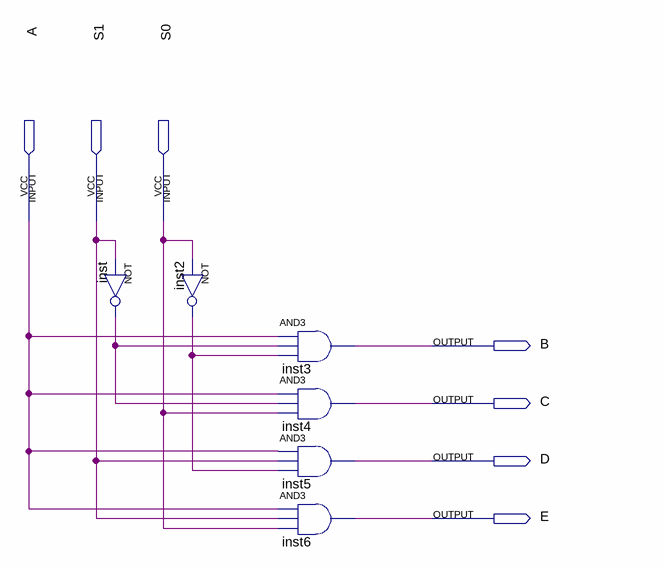
[diagram p0: schematic sheet]
// Quartus schematic Lab1Trial1.bdf as structural Verilog: 6 symbols, 7 pins
module Lab1Trial1 (
  input  A,
  input  S1,
  input  S0,
  output B,
  output C,
  output D,
  output E
);

  wire inst2_out, inst_out;

  not inst (inst_out, S1);
  not inst2 (inst2_out, S0);
  and inst3 (B, A, inst_out, inst2_out);
  and inst4 (C, A, inst_out, S0);
  and inst5 (D, A, S1, inst2_out);
  and inst6 (E, A, S1, S0);
endmodule
